# Altium project quadruped_hat.PrjPcb
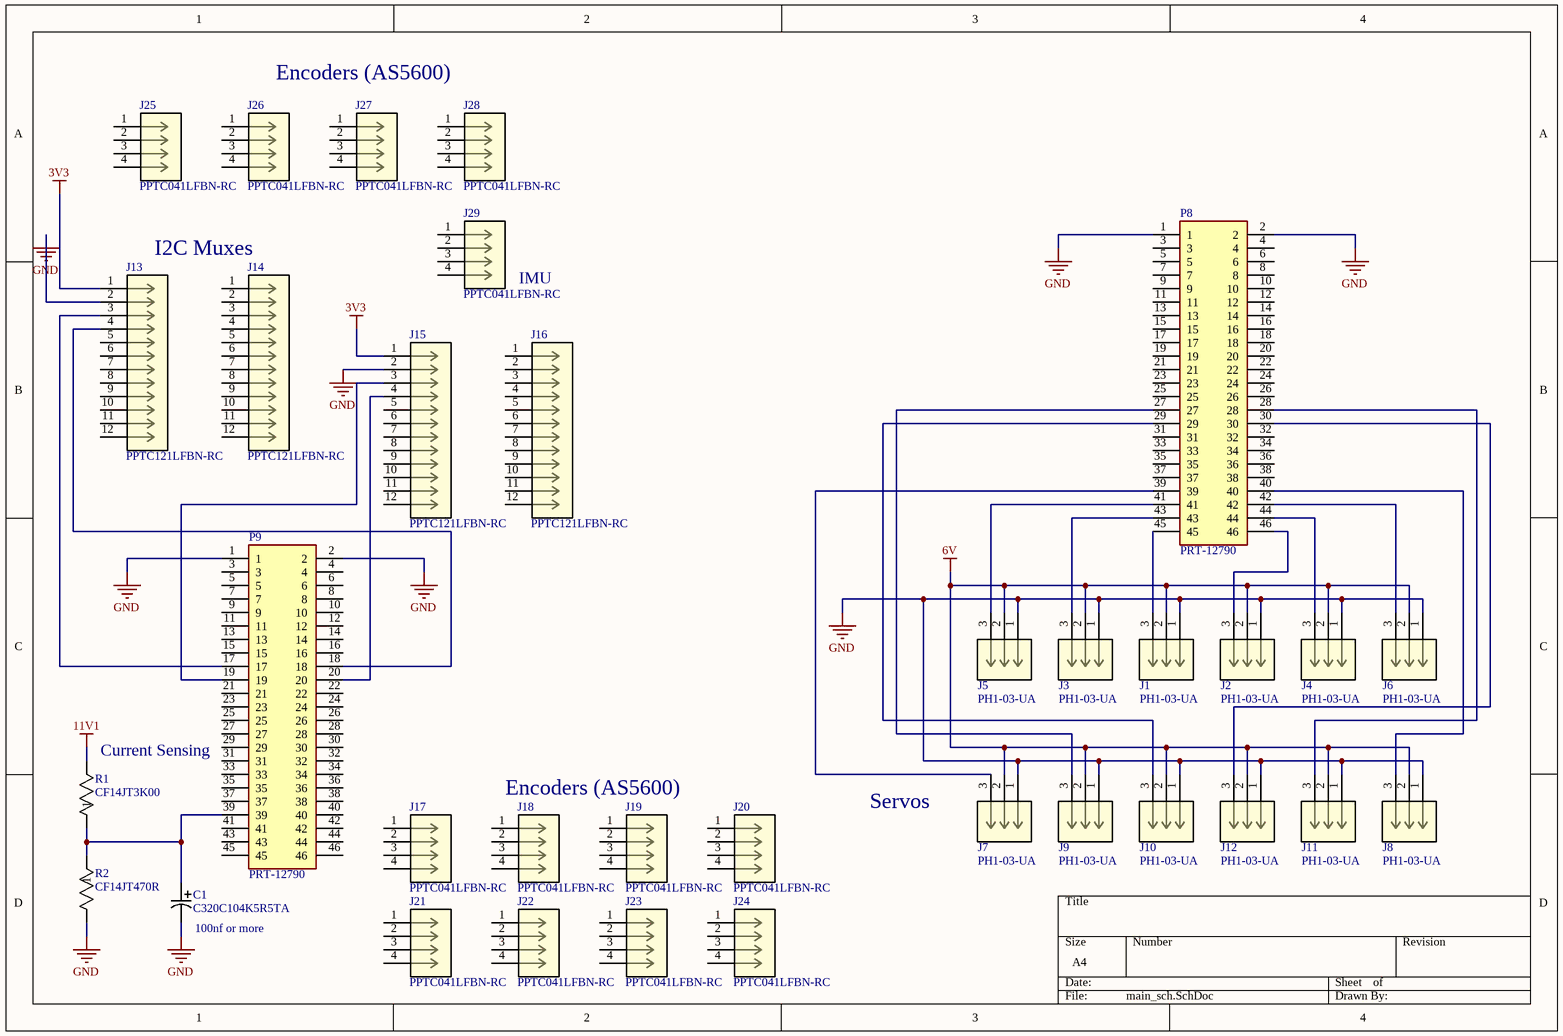
[diagram p0: main_sch.SchDoc]
1 sheet, 34 parts. Net scope: global (net labels, ports and power ports of the same name join across sheets).

## Sheet main_sch.SchDoc
size A4; SheetNumber: 1; SheetTotal: 1

### Parts
C1  C320C104K5R5TA  [CAP_C320_KEM]
J1  PH1-03-UA  [CONN_PH1-03-UA_ADM]
J2  PH1-03-UA  [CONN_PH1-03-UA_ADM]
J3  PH1-03-UA  [CONN_PH1-03-UA_ADM]
J4  PH1-03-UA  [CONN_PH1-03-UA_ADM]
J5  PH1-03-UA  [CONN_PH1-03-UA_ADM]
J6  PH1-03-UA  [CONN_PH1-03-UA_ADM]
J7  PH1-03-UA  [CONN_PH1-03-UA_ADM]
J8  PH1-03-UA  [CONN_PH1-03-UA_ADM]
J9  PH1-03-UA  [CONN_PH1-03-UA_ADM]
J10  PH1-03-UA  [CONN_PH1-03-UA_ADM]
J11  PH1-03-UA  [CONN_PH1-03-UA_ADM]
J12  PH1-03-UA  [CONN_PH1-03-UA_ADM]
J13  PPTC121LFBN-RC  [Conn12_1p2x0p1_SUL]
J14  PPTC121LFBN-RC  [Conn12_1p2x0p1_SUL]
J15  PPTC121LFBN-RC  [Conn12_1p2x0p1_SUL]
J16  PPTC121LFBN-RC  [Conn12_1p2x0p1_SUL]
J17  PPTC041LFBN-RC  [CONN_PPTC041LFBN-RC_SUL]
J18  PPTC041LFBN-RC  [CONN_PPTC041LFBN-RC_SUL]
J19  PPTC041LFBN-RC  [CONN_PPTC041LFBN-RC_SUL]
J20  PPTC041LFBN-RC  [CONN_PPTC041LFBN-RC_SUL]
J21  PPTC041LFBN-RC  [CONN_PPTC041LFBN-RC_SUL]
J22  PPTC041LFBN-RC  [CONN_PPTC041LFBN-RC_SUL]
J23  PPTC041LFBN-RC  [CONN_PPTC041LFBN-RC_SUL]
J24  PPTC041LFBN-RC  [CONN_PPTC041LFBN-RC_SUL]
J25  PPTC041LFBN-RC  [CONN_PPTC041LFBN-RC_SUL]
J26  PPTC041LFBN-RC  [CONN_PPTC041LFBN-RC_SUL]
J27  PPTC041LFBN-RC  [CONN_PPTC041LFBN-RC_SUL]
J28  PPTC041LFBN-RC  [CONN_PPTC041LFBN-RC_SUL]
J29  PPTC041LFBN-RC  [CONN_PPTC041LFBN-RC_SUL]
P8  PRT-12790  [PRT12790]
P9  PRT-12790  [PRT12790]
R1  CF14JT3K00  [STA_CF14_STP]
R2  CF14JT470R  [STA_CF14_STP]

### Nets
3V3: J13.1 J15.1
6V: J1.2 J2.2 J3.2 J4.2 J5.2 J6.2 J7.2 J8.2 J9.2 J10.2 J11.2 J12.2
11V1: R1.2
GND: C1.2 J1.1 J2.1 J3.1 J4.1 J5.1 J6.1 J7.1 J8.1 J9.1 J10.1 J11.1 J12.1 J13.2 J15.2 P8.1 P8.2 P9.1 P9.2 R2.2
NetC1_1: C1.1 P9.39 R1.1 R2.1
NetJ1_3: J1.3 P8.45
NetJ2_3: J2.3 P8.46
NetJ3_3: J3.3 P8.43
NetJ4_3: J4.3 P8.44
NetJ5_3: J5.3 P8.41
NetJ6_3: J6.3 P8.42
NetJ7_3: J7.3 P8.39
NetJ8_3: J8.3 P8.40
NetJ9_3: J9.3 P8.27
NetJ10_3: J10.3 P8.29
NetJ11_3: J11.3 P8.28
NetJ12_3: J12.3 P8.30
NetJ13_3: J13.3 P9.17
NetJ13_4: J13.4 P9.18
NetJ15_3: J15.3 P9.19
NetJ15_4: J15.4 P9.20

Not connected (* = marked no-connect by the designer): J13 5 6 7 8 9 10 11 12; J14 1 2 3 4 5 6 7 8 9 10 11 12; J15 5 6 7 8 9 10 11 12; J16 1 2 3 4 5 6 7 8 9 10 11 12; J17 1 2 3 4; J18 1 2 3 4; J19 1 2 3 4; J20 1 2 3 4; J21 1 2 3 4; J22 1 2 3 4; J23 1 2 3 4; J24 1 2 3 4; J25 1 2 3 4; J26 1 2 3 4; J27 1 2 3 4; J28 1 2 3 4; J29 1 2 3 4; P8 3 4 5 6 7 8 9 10 11 12 13 14 15 16 17 18 19 20 21 22 23 24 25 26 31 32 33 34 35 36 37 38; P9 3 4 5 6 7 8 9 10 11 12 13 14 15 16 21 22 23 24 25 26 27 28 29 30 31 32 33 34 35 36 37 38 40 41 42 43 44 45 46

### Notes on the sheet
- Encoders (AS5600)
- I2C Muxes
- IMU
- Current Sensing
- Servos
- (near C1) 100nf or more

### Library data of the parts
C1 = C320C104K5R5TA: Description; Manufacturer_Name: Kemet; Copyright: Copyright (C) 2025 Ultra Librarian. All rights reserved.; Manufacturer_Part_Number: C320C104K5R5TA
J1-J12 = PH1-03-UA: Description; Manufacturer_Name: ADAM TECHNOLOGIES INC; Copyright: Copyright (C) 2025 Ultra Librarian. All rights reserved.; Manufacturer_Part_Number: PH1-03-UA; RefDes: RefDes; Type: Type
J13-J16 = PPTC121LFBN-RC: CONN HEADER FEMALE 12POS.1 TIN; Manufacturer_Name: Sullins; Copyright: Copyright (C) 2026 Ultra Librarian. All rights reserved.; Manufacturer_Part_Number: PPTC121LFBN-RC; RefDes: RefDes; Type: Type
J17-J29 = PPTC041LFBN-RC: Description; Manufacturer_Name: Sullins; Copyright: Copyright (C) 2026 Ultra Librarian. All rights reserved.; Manufacturer_Part_Number: PPTC041LFBN-RC; RefDes: RefDes; Type: Type
P8 P9 = PRT-12790: SparkFun Accessories Stackable Header 2x23 Pin Female; Geometry.Height: 8.65mm; Manufacturer_Name: SparkFun; Manufacturer_Part_Number: PRT-12790; Mouser Part Number: 474-PRT-12790; Mouser Price/Stock: https://www.mouser.co.uk/ProductDetail/SparkFun/PRT-12790?qs=WyAARYrbSnZh0%252BVGZi59Ng%3D%3D; Arrow Part Number: PRT-12790; Arrow Price/Stock: https://www.arrow.com/en/products/prt-12790/sparkfun-electronics; Datasheet Link: https://cdn.sparkfun.com/datasheets/Prototyping/20218.pdf
R1 = CF14JT3K00: Description; Manufacturer_Name: Stackpole International; Copyright: Copyright (C) 2025 Ultra Librarian. All rights reserved.; Manufacturer_Part_Number: CF14JT3K00
R2 = CF14JT470R: Description; Manufacturer_Name: Stackpole International; Copyright: Copyright (C) 2026 Ultra Librarian. All rights reserved.; Manufacturer_Part_Number: CF14JT470R